# Altium schematic sheet 2_MCU.schdoc
size 297 x 209 mm; Symbol: Drawing-Symbol_A4; Device: Drawing-Symbol_A4; @Project Name: Irrigation Controller v2; @Page Count: 5; @Update Date: 2026-11-21; @Create Date: 2026-11-21; @Schematic Name: Schematic1; @Page No: 2; @Page Name: 2_MCU; Company: EasyEDA.com; Version: V1.0; Page Size: A4; @Create Time: 17:28:43; @Update Time: 17:28:43; Border: 1; Width: 1170; Height: 825; Region Start: 1; X Region Count: 6; Y Region Count: 4; Blade Width: 10; Title Block Position: 3; @Board Name: Board1
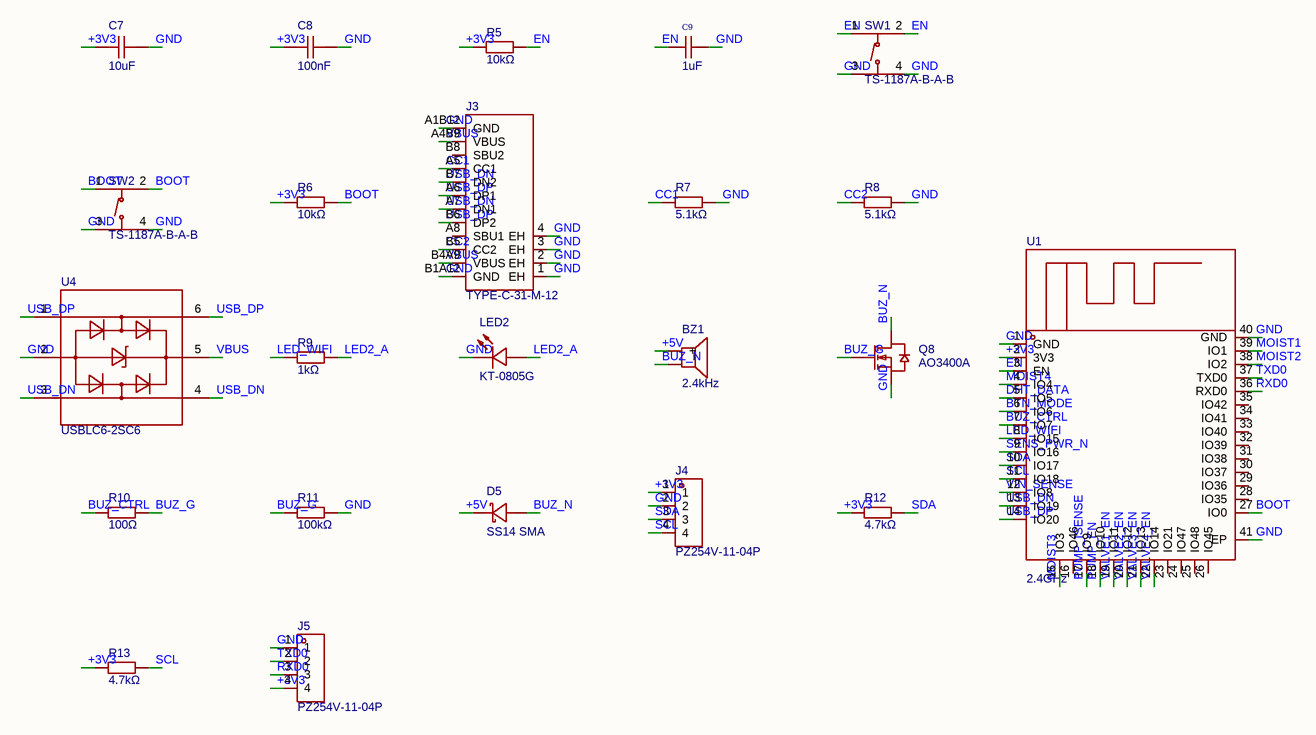
[diagram p0: 2_MCU.schdoc]

## Parts
BZ1  2.4kHz  [BUZ-TH_BD12.0-P7.60-D0.6-FD]
C7  10uF  [C0805]
C8  100nF  [C0805]
C9  1uF  [C0805]
D5  SS14 SMA  [SMA_L4.3-W2.6-LS5.1-RD]
J3  TYPE-C-31-M-12  [USB-C_SMD-TYPE-C-31-M-12_1]
J4  PZ254V-11-04P  [HDR-TH_4P-P2.54-V-M]
J5  PZ254V-11-04P  [HDR-TH_4P-P2.54-V-M]
LED2  KT-0805G  [LED0805-R-RD]
Q8  AO3400A  [SOT-23-3_L2.9-W1.3-P1.90-LS2.4-BR]
R5  10kΩ  [R0805]
R6  10kΩ  [R0805]
R7  5.1kΩ  [R0805]
R8  5.1kΩ  [R0805]
R9  1kΩ  [R0805]
R10  100Ω  [R0805]
R11  100kΩ  [R0805]
R12  4.7kΩ  [R0805]
R13  4.7kΩ  [R0805]
SW1  TS-1187A-B-A-B  [SW-SMD_4P-L5.1-W5.1-P3.70-LS6.5-TL_H1.5]
SW2  TS-1187A-B-A-B  [SW-SMD_4P-L5.1-W5.1-P3.70-LS6.5-TL_H1.5]
U1  2.4GHz  [WIFIM-SMD_ESP32-S3-WROOM-1-N8]
U4  USBLC6-2SC6  [SOT-23-6_L2.9-W1.6-P0.95-LS2.8-BL]

## Nets
+3V3: C7.1 C8.1 J4.1 J5.4 R5.1 R6.1 R12.1 R13.1 U1.2(3V3)
+5V: BZ1.1(+) D5.1(K)
BOOT: R6.2 SW2.1(A) SW2.2(B) U1.27(IO0)
BTN_MODE: U1.6(IO6)
BUZ_CTRL: R10.1 U1.7(IO7)
BUZ_G: Q8.1(G) R10.2 R11.1
BUZ_N: BZ1.2 D5.2(A) Q8.3(D)
CC1: J3.A5(CC1) R7.1
CC2: J3.B5(CC2) R8.1
DHT_DATA: U1.5(IO5)
EN: C9.1 R5.2 SW1.1(A) SW1.2(B) U1.3(EN)
GND: C7.2 C8.2 C9.2 J3.1(EH) J3.2(EH) J3.3(EH) J3.4(EH) J3.A1B12(GND) J3.B1A12(GND) J4.2 J5.1 LED2.2(K) Q8.2(S) R7.2 R8.2 R11.2 SW1.3(C) SW1.4(D) SW2.3(C) SW2.4(D) U1.1(GND) U1.40(GND) U1.41(EP) U4.2
LED2_A: LED2.1(A) R9.2
LED_WIFI: R9.1 U1.8(IO15)
MOIST1: U1.39(IO1)
MOIST2: U1.38(IO2)
MOIST3: U1.15(IO3)
MOIST4: U1.4(IO4)
PUMP_EN: U1.18(IO10)
PUMP_ISENSE: U1.17(IO9)
RXD0: J5.3 U1.36(RXD0)
SCL: J4.4 R13.2 U1.11(IO18)
SDA: J4.3 R12.2 U1.10(IO17)
SENS_PWR_N: U1.9(IO16)
TXD0: J5.2 U1.37(TXD0)
USB_DN: J3.A7(DN1) J3.B7(DN2) U1.13(IO19) U4.3 U4.4
USB_DP: J3.A6(DP1) J3.B6(DP2) U1.14(IO20) U4.1 U4.6
VALVE1_EN: U1.19(IO11)
VALVE2_EN: U1.20(IO12)
VALVE3_EN: U1.21(IO13)
VALVE4_EN: U1.22(IO14)
VBUS: J3.A4B9(VBUS) J3.B4A9(VBUS) U4.5
VIN_SENSE: U1.12(IO8)

Not connected (* = marked no-connect by the designer): J3 A8(SBU1) B8(SBU2); U1 16(IO46) 23(IO21) 24(IO47) 25(IO48) 26(IO45) 28(IO35) 29(IO36) 30(IO37) 31(IO38) 32(IO39) 33(IO40) 34(IO41) 35(IO42)

## Notes on the sheet
- Create at
- 2026-11-21
- Schematic
- Board
- Schematic1
- Board1
- Update at
- Page
- 2_MCU
- Drawn
- Reviewed
- Irrigation Controller v2
- Version
- V1.0
- Size
- A4
- Page  2  Total  5
- EasyEDA.com

## Library data of the parts
BZ1 = TMB12A05: Driver Circuitry:Active Buzzer (Built-in Driving Circuit) Technology:Electromagnetic Voltage Rating:5V Voltage - Supply:4V~8V Voltage - Supply:4V~8V Frequency:2.4kHz Current Consumption:30mA Sound Pressure Level(SPL):85dB Diameter(φD):12mm Length:- Width:; Manufacturer: 华能; Add into BOM: yes; PCB Layer: Default; Voltage Rating: 5V; Voltage - Supply: 4V~8V; Current Consumption: 30mA; Sound Pressure Level(SPL): 85dB; ModelId: 309f522c52df4298a8617da4d1b9f47c|0819f05c4eef4c71ace90d822a990e87; ModelName: BUZ-TH_D12.0-H9.5-P7.60; ModelTransform: 472.44,472.176,0,90,0,0,-0.787,0,-177.165; Symbol: TMB12A05; Device: TMB12A05; Convert to PCB: yes; Manufacturer Part: TMB12A05; Supplier: LCSC; Supplier Part: C96093; LCSC Part Name: 有源(内含驱动线路) 电磁式 2.4kHz; Supplier Footprint: 插件,D=12mm; JLCPCB Part Class: Extended Part; Datasheet: https://item.szlcsc.com/datasheet/TMB12A05/97297.html; Driver Circuitry: Active Buzzer (Built-in Driving Circuit); Technology: Electromagnetic; Value: 2.4kHz; Diameter(φD): 12mm; Length: -; Width: -; Height: 9.8mm; Operating Temperature: -40℃~+85℃; Mounting Type: Through-hole; Lead Pitch: -; Continuous Operating Time: -; FootprintName: BUZ-TH_BD12.0-P7.60-D0.6-FD
C7 = CL21A106KAYNNNE_C15850: Capacitance:10uF Tolerance:±10% Tolerance:±10% Voltage Rating:25V Temperature Coefficient:X5R; Manufacturer: SAMSUNG(三星); Add into BOM: yes; PCB Layer: Default; Tolerance: ±10%; Voltage Rating: 25V; Temperature Coefficient: X5R; ModelId: 8c88e81f49c6409b980720ec8953afb6|0819f05c4eef4c71ace90d822a990e87; ModelName: C0805_L2.0-W1.3-H1.3; ModelTransform: 78.74,51.181,0,0,0,0,0,0.0005,0; Symbol: CL21A106KAYNNNE; Device: CL21A106KAYNNNE_C15850; Convert to PCB: yes; Manufacturer Part: CL21A106KAYNNNE; Supplier: LCSC; Supplier Part: C15850; LCSC Part Name: 10uF ±10% 25V; Supplier Footprint: 0805; JLCPCB Part Class: Basic Part; Datasheet: https://item.szlcsc.com/datasheet/CL21A106KAYNNNE/16532.html; Value: 10uF; FootprintName: C0805
C8 = CC0805KRX7R9BB104: Capacitance:100nF Tolerance:±10% Tolerance:±10% Voltage Rating:50V Temperature Coefficient:X7R; Manufacturer: YAGEO(国巨); Add into BOM: yes; PCB Layer: Default; Tolerance: ±10%; Voltage Rating: 50V; Temperature Coefficient: X7R; ModelId: 8c88e81f49c6409b980720ec8953afb6|0819f05c4eef4c71ace90d822a990e87; ModelName: C0805_L2.0-W1.3-H1.3; ModelTransform: 78.74,51.181,0,0,0,0,0,0.0005,0; Symbol: CC0805KRX7R9BB104; Device: CC0805KRX7R9BB104; Convert to PCB: yes; Manufacturer Part: CC0805KRX7R9BB104; Supplier: LCSC; Supplier Part: C49678; LCSC Part Name: 100nF ±10% 50V; Supplier Footprint: 0805; JLCPCB Part Class: Basic Part; Datasheet: https://item.szlcsc.com/datasheet/CC0805KRX7R9BB104/50686.html; Value: 100nF; FootprintName: C0805
C9 = CL21B105KBFNNNE: Capacitance:1uF Tolerance:±10% Tolerance:±10% Voltage Rating:50V Temperature Coefficient:X7R; Manufacturer: SAMSUNG(三星); Add into BOM: yes; PCB Layer: Default; Tolerance: ±10%; Voltage Rating: 50V; Temperature Coefficient: X7R; ModelId: 8c88e81f49c6409b980720ec8953afb6|0819f05c4eef4c71ace90d822a990e87; ModelName: C0805_L2.0-W1.3-H1.3; ModelTransform: 78.74,51.181,0,0,0,0,0,0.0005,0; Symbol: CL21B105KBFNNNE; Device: CL21B105KBFNNNE; Convert to PCB: yes; Manufacturer Part: CL21B105KBFNNNE; Supplier: LCSC; Supplier Part: C28323; Value: 1uF; JLCPCB Part Class: Basic Part; LCSC Part Name: 1uF ±10% 50V; Supplier Footprint: 0805; Datasheet: https://item.szlcsc.com/datasheet/CL21B105KBFNNNE/29074.html; FootprintName: C0805
D5 = SS14 SMA: Diode Configuration:1 Independent Voltage - Forward(Vf@If):550mV@1A Voltage - DC Reverse(Vr):40V Current - Rectified:1A Reverse Leakage Current (Ir):500uA@40V Operating Junction Temperature Range:-65℃~+125℃ Operating Junction Temperature Range:-65℃~+125℃; Manufacturer: Yint(音特电子); Add into BOM: yes; PCB Layer: Default; Voltage - DC Reverse(Vr): 40V; Current - Rectified: 1A; Non-Repetitive Peak Forward Surge Current: 40A; ModelId: 9f0f28a3f5e244ceb50a0213b7a9858d|0819f05c4eef4c71ace90d822a990e87; ModelTransform: 196.4563,102.362,0,0,0,0,0.001,-0.001,0; Symbol: SS14 SMA; Device: SS14 SMA; Convert to PCB: yes; Manufacturer Part: SS14 SMA; Supplier: LCSC; Supplier Part: C2920036; LCSC Part Name: 电压:40V 电流:1A; Supplier Footprint: SMA(DO-214AC); JLCPCB Part Class: Extended Part; Datasheet: https://item.szlcsc.com/datasheet/SS14%2520SMA/3223905.html; Diode Configuration: 1 Independent; Voltage - Forward(Vf@If): 550mV@1A; Reverse Leakage Current (Ir): 500uA@40V; Operating Junction Temperature Range: -65℃~+125℃; FootprintName: SMA_L4.3-W2.6-LS5.1-RD; ModelName: SMA_L4.3-W2.6-LS5.1-RD
J3 = TYPE-C-31-M-12: Connector Type:Type-C Protocol Standard:- Gender:Female Mounting Type:Surface Mount, Right Angle Number of Contacts:16P Number of Ports:1 Current Rating-Power:5A Voltage Rating:20V Connect-Disconnect Life:10,000 cycles Length:7.35mm Operating Temperature:; Manufacturer: 韩国韩荣; Add into BOM: yes; PCB Layer: Default; Connector Type: Type-C; Gender: Female; Number of Contacts: 16P; Number of Ports: 1; Current Rating-Power: 5A; Voltage Rating: 20V; ModelId: 8421221a464047838322348b3a9debc3|0819f05c4eef4c71ace90d822a990e87; ModelTransform: 351.9678,311.023,0,180,0,0,0,-43.307,-33.465; Symbol: TYPE-C-31-M-12; Device: TYPE-C-31-M-12; Convert to PCB: yes; Manufacturer Part: TYPE-C-31-M-12; Supplier: LCSC; Supplier Part: C165948; LCSC Part Name: Type-C 母 卧贴; Supplier Footprint: SMD; JLCPCB Part Class: Extended Part; Datasheet: https://item.szlcsc.com/datasheet/TYPE-C-31-M-12/177331.html; Protocol Standard: -; Mounting Type: Surface Mount, Right Angle; Connect-Disconnect Life: 10,000 cycles; Length: 7.35mm; Operating Temperature: -30℃~+80℃; FootprintName: USB-C_SMD-TYPE-C-31-M-12_1; ModelName: USB-C_SMD-TYPE-C-31-M-12_1
J4 J5 = PZ254V-11-04P_C492403: Pin Structure:1x4P Pitch:2.54mm Row Spacing:- Circluar Pins/Square Pins:Square pin Mounting Type:Through Hole Number of Rows:1 Number of Pins:4P Current Rating:3A Voltage Rating (Max):250V Length of Mating Pin:6.1mm Insulation Height:2.5mm Length of End C; Manufacturer: XFCN(兴飞); Add into BOM: yes; PCB Layer: Default; Pin Structure: 1x4P; Pitch: 2.54mm; Current Rating: 3A; Voltage Rating (Max): 250V; ModelId: 69e0934d9b9245f6ab499bc5a319b3aa|0819f05c4eef4c71ace90d822a990e87; ModelName: HDR-TH_4P-P2.54-M-LI-1X4P; ModelTransform: 399.999,104.7242,0,0,0,0,0,0,-118.11; Symbol: PZ254V-11-04P; Device: PZ254V-11-04P_C492403; Convert to PCB: yes; Manufacturer Part: PZ254V-11-04P; Supplier: LCSC; Supplier Part: C492403; LCSC Part Name: 1x4P 间距:2.54mm 方针 直插; Supplier Footprint: 插件,P=2.54mm; JLCPCB Part Class: Extended Part; Datasheet: https://item.szlcsc.com/datasheet/PZ254V-11-04P/502959.html; Row Spacing: -; Circluar Pins/Square Pins: Square pin; Mounting Type: Through Hole; Number of Rows: 1; Number of Pins: 4P; Length of Mating Pin: 6.1mm; Insulation Height: 2.5mm; Length of End Connection Pin: 3mm; Contact Material: Brass; Contact Plating: Gold; Operating Temperature: -40℃~+105℃; Color: Black; FootprintName: HDR-TH_4P-P2.54-V-M
LED2 = KT-0805G: Lamp Holder Type:2mm x 1.25mm square LED Illumination Color:Emerald Green Voltage - Forward(Vf):2.6V~3.1V Voltage - Forward(Vf):2.6V~3.1V Power(Watts):100mW Forward Current:5mA Wavelength - Dominant:513nm~528nm Wavelength - Dominant:513nm~528nm Peak Wavel; Manufacturer: KENTO; Symbol: 0805G (Green); Add into BOM: yes; PCB Layer: Default; Power(Watts): 100mW; Forward Current: 5mA; Peak Wavelength: 525nm; Diode Configuration: Discrete Diode; Lens Color: Water Clear; Luminous Intensity: 430mcd; Viewing Angle: 120°; ModelId: 167045bb0eae412b9d5564860e113a91|0819f05c4eef4c71ace90d822a990e87; ModelName: LED0805-RD; ModelTransform: 79.527,49.2125,0,0,0,0,0,0,0; Device: KT-0805G; Convert to PCB: yes; Manufacturer Part: KT-0805G; Supplier: LCSC; Supplier Part: C2297; LCSC Part Name: 0805 翠绿 高亮; Supplier Footprint: 0805; JLCPCB Part Class: Basic Part; Datasheet: https://item.szlcsc.com/datasheet/KT-0805G/2670.html; Lamp Holder Type: 2mm x 1.25mm square LED; Illumination Color: Emerald Green; Voltage - Forward(Vf): 2.6V~3.1V; Wavelength - Dominant: 513nm~528nm; Color Temperature: -; Mounting Style: -; Operating Temperature: -40℃~+85℃; FootprintName: LED0805-R-RD
Q8 = AO3400A_C20917: Number:1 N-channel Drain to Source Voltage:30V Current - Continuous Drain(Id):5.7A RDS(on):48mΩ@2.5V Pd - Power Dissipation:1.4W Gate Threshold Voltage (Vgs(th)):1.45V Gate Charge(Qg):7nC@10V Input Capacitance(Ciss):630pF Reverse Transfer Capacitance (Crs; Manufacturer: AOS; Add into BOM: yes; PCB Layer: Default; Drain to Source Voltage: 30V; Current - Continuous Drain(Id): 5.7A; Pd - Power Dissipation: 1.4W; Gate Threshold Voltage (Vgs(th)): 1.45V; Input Capacitance(Ciss): 630pF; Reverse Transfer Capacitance (Crss@Vds): 50pF; Output Capacitance(Coss): 75pF; Vgs: ±12V; ModelId: 62a57c6760504a01965db6419a6d07df|0819f05c4eef4c71ace90d822a990e87; ModelName: SOT-23-3P_L2.9-W1.3-H1.0-LS2.4-P0.95; ModelTransform: 98.425,114.173,0,180,0,0,0.0005,-0.0005,0; Symbol: AO3400A; Device: AO3400A_C20917; Convert to PCB: yes; Manufacturer Part: AO3400A; Supplier: LCSC; Supplier Part: C20917; LCSC Part Name: N沟道 耐压:30V; Supplier Footprint: SOT-23; JLCPCB Part Class: Basic Part; Datasheet: https://item.szlcsc.com/datasheet/AO3400A/21629.html; Number: 1 N-channel; RDS(on): 48mΩ@2.5V; Gate Charge(Qg): 7nC@10V; Operating Temperature: -55℃~+150℃; Configuration: -; Type: N-Channel; FootprintName: SOT-23-3_L2.9-W1.3-P1.90-LS2.4-BR
R5 R6 = 0805W8F1002T5E: Type:Thick Film Resistor Resistance:10kΩ Tolerance:±1% Tolerance:±1% Power(Watts):125mW Voltage-Supply(Max):150V Temperature Coefficient:±100ppm/℃ Temperature Coefficient:±100ppm/℃ Operating Temperature:-55℃~+155℃ Operating Temperature:-55℃~+155℃; Manufacturer: UNI-ROYAL(厚声); Add into BOM: yes; PCB Layer: Default; Tolerance: ±1%; Power(Watts): 125mW; Voltage-Supply(Max): 150V; ModelId: b83c7c5430874b8eb2319a65d9433429|0819f05c4eef4c71ace90d822a990e87; ModelName: R0805_L2.0-W1.3-H0.6; ModelTransform: 78.74,51.181,0,0,0,0,0,-0.0005,0; Symbol: 0805W8F1002T5E; Device: 0805W8F1002T5E; Convert to PCB: yes; Manufacturer Part: 0805W8F1002T5E; Supplier: LCSC; Supplier Part: C17414; LCSC Part Name: 厚膜电阻 10kΩ ±1%; Supplier Footprint: 0805; JLCPCB Part Class: Basic Part; Datasheet: https://item.szlcsc.com/datasheet/0805W8F1002T5E/18102.html; Type: Thick Film Resistor; Value: 10kΩ; Temperature Coefficient: ±100ppm/℃; Operating Temperature: -55℃~+155℃; FootprintName: R0805
R7 R8 = 0805W8F5101T5E: Type:Thick Film Resistor Resistance:5.1kΩ Tolerance:±1% Tolerance:±1% Power(Watts):125mW Voltage-Supply(Max):150V Temperature Coefficient:±100ppm/℃ Temperature Coefficient:±100ppm/℃ Operating Temperature:-55℃~+155℃ Operating Temperature:-55℃~+155℃; Manufacturer: UNI-ROYAL(厚声); Add into BOM: yes; PCB Layer: Default; Tolerance: ±1%; Power(Watts): 125mW; Voltage-Supply(Max): 150V; ModelId: b83c7c5430874b8eb2319a65d9433429|0819f05c4eef4c71ace90d822a990e87; ModelName: R0805_L2.0-W1.3-H0.6; ModelTransform: 78.74,51.181,0,0,0,0,0,-0.0005,0; Symbol: 0805W8F5101T5E; Device: 0805W8F5101T5E; Convert to PCB: yes; Manufacturer Part: 0805W8F5101T5E; Supplier: LCSC; Supplier Part: C27834; LCSC Part Name: 厚膜电阻 5.1kΩ ±1%; Supplier Footprint: 0805; JLCPCB Part Class: Basic Part; Datasheet: https://item.szlcsc.com/datasheet/0805W8F5101T5E/28584.html; Type: Thick Film Resistor; Value: 5.1kΩ; Temperature Coefficient: ±100ppm/℃; Operating Temperature: -55℃~+155℃; FootprintName: R0805
R9 = 0805W8F1001T5E: Type:Thick Film Resistors Resistance:1kΩ Tolerance:±1% Tolerance:±1% Power(Watts): Overload Voltage (Max): Temperature Coefficient:±100ppm/℃ Temperature Coefficient:±100ppm/℃ Operating Temperature Range:-55℃~+155℃ Operating Temperature Range:-55℃~+155℃; Manufacturer: UNI-ROYAL(厚声); Add into BOM: yes; PCB Layer: Default; Tolerance: ±1%; ModelId: b83c7c5430874b8eb2319a65d9433429|0819f05c4eef4c71ace90d822a990e87; ModelName: R0805_L2.0-W1.3-H0.6; ModelTransform: 78.74,51.181,0,0,0,0,0,-0.0005,0; Symbol: 0805W8F1001T5E; Device: 0805W8F1001T5E; Convert to PCB: yes; Manufacturer Part: 0805W8F1001T5E; Supplier: LCSC; Supplier Part: C17513; LCSC Part Name: 1kΩ ±1% 125mW 厚膜电阻; Supplier Footprint: 0805; JLCPCB Part Class: Basic Part; Datasheet: https://atta.szlcsc.com/upload/public/pdf/source/20200306/C422600_1E6D84923E4A46A82E41ADD87F860B5C.pdf; Type: Thick Film Resistors; Value: 1kΩ; Temperature Coefficient: ±100ppm/℃; Operating Temperature Range: -55℃~+155℃; FootprintName: R0805
R10 = 0805W8F1000T5E_C17408: Type:Thick Film Resistors Resistance: Tolerance:±1% Tolerance:±1% Power(Watts): Overload Voltage (Max): Temperature Coefficient:±100ppm/℃ Temperature Coefficient:±100ppm/℃ Operating Temperature Range:-55℃~+155℃ Operating Temperature Range:-55℃~+155℃; Manufacturer: UNI-ROYAL(厚声); Add into BOM: yes; PCB Layer: Default; Tolerance: ±1%; ModelId: b83c7c5430874b8eb2319a65d9433429|0819f05c4eef4c71ace90d822a990e87; ModelName: R0805_L2.0-W1.3-H0.6; ModelTransform: 78.74,51.181,0,0,0,0,0,-0.0005,0; Symbol: 0805W8F1000T5E; Device: 0805W8F1000T5E_C17408; Convert to PCB: yes; Manufacturer Part: 0805W8F1000T5E; Supplier: LCSC; Supplier Part: C17408; LCSC Part Name: 100Ω ±1% 125mW 厚膜电阻; Supplier Footprint: 0805; JLCPCB Part Class: Basic Part; Datasheet: https://atta.szlcsc.com/upload/public/pdf/source/20200306/C422600_1E6D84923E4A46A82E41ADD87F860B5C.pdf; Type: Thick Film Resistors; Value: 100Ω; Temperature Coefficient: ±100ppm/℃; Operating Temperature Range: -55℃~+155℃; FootprintName: R0805
R11 = 0805W8F1003T5E (SMT业务专用): Type: Resistance: Tolerance:±1% Tolerance:±1% Power(Watts):- Overload Voltage (Max):-; Manufacturer: UNI-ROYAL(厚声); Add into BOM: yes; PCB Layer: Default; Tolerance: ±1%; ModelId: b83c7c5430874b8eb2319a65d9433429|0819f05c4eef4c71ace90d822a990e87; ModelName: R0805_L2.0-W1.3-H0.6; ModelTransform: 78.74,51.181,0,0,0,0,0,-0.0005,0; Symbol: 0805W8F1003T5E; Device: 0805W8F1003T5E (SMT业务专用); Convert to PCB: yes; Manufacturer Part: 0805W8F1003T5E (SMT业务专用); Supplier: LCSC; Supplier Part: C17407; LCSC Part Name: 100kΩ ±1%; Supplier Footprint: 0805; JLCPCB Part Class: Extended Part; Datasheet: https://atta.szlcsc.com/upload/public/pdf/source/20200102/C423413_58AC64FF5730584578C10BF0002471B1.pdf; Value: 100kΩ; Power(Watts): -; Overload Voltage (Max): -; FootprintName: R0805
R12 R13 = 0805W8F4701T5E: Type:Thick Film Resistors Resistance:4.7kΩ Tolerance:±1% Tolerance:±1% Power(Watts): Overload Voltage (Max): Temperature Coefficient:±100ppm/℃ Temperature Coefficient:±100ppm/℃ Operating Temperature Range:-55℃~+155℃ Operating Temperature Range:-55℃~+155℃; Manufacturer: UNI-ROYAL(厚声); Add into BOM: yes; PCB Layer: Default; Tolerance: ±1%; ModelId: b83c7c5430874b8eb2319a65d9433429|0819f05c4eef4c71ace90d822a990e87; ModelName: R0805_L2.0-W1.3-H0.6; ModelTransform: 78.74,51.181,0,0,0,0,0,-0.0005,0; Symbol: 0805W8F4701T5E; Device: 0805W8F4701T5E; Convert to PCB: yes; Manufacturer Part: 0805W8F4701T5E; Supplier: LCSC; Supplier Part: C17673; LCSC Part Name: 4.7kΩ ±1% 125mW 厚膜电阻; Supplier Footprint: 0805; JLCPCB Part Class: Basic Part; Datasheet: https://atta.szlcsc.com/upload/public/pdf/source/20200306/C422600_1E6D84923E4A46A82E41ADD87F860B5C.pdf; Type: Thick Film Resistors; Value: 4.7kΩ; Temperature Coefficient: ±100ppm/℃; Operating Temperature Range: -55℃~+155℃; FootprintName: R0805
SW1 SW2 = TS-1187A-B-A-B: Circuit:SPST Actuator Style:Round Button Operating Force:1.6N Mounting Type:Surface Mount,Vertical Length:5.1mm Width:5.1mm Switch Height:1.5mm with Bracket:Without Bracket Contact Current:50mA Voltage Rating:12V Actuator/Cap Color:Gold With Lamp:No Life:; Manufacturer: XKB Connection(中国星坤); Add into BOM: yes; PCB Layer: Default; Circuit: SPST; Operating Force: 1.6N; Switch Height: 1.5mm; Contact Current: 50mA; Voltage Rating: 12V; Actuator/Cap Color: Gold; With Lamp: No; Life: 100,000 cycles; ModelId: 297e93217c8a461096f3cf9cc3d4db3d|0819f05c4eef4c71ace90d822a990e87; ModelTransform: 255.905,204.76337,0,0,0,0,0,0,0; Symbol: TS-1187A-B-A-B; Device: TS-1187A-B-A-B; Convert to PCB: yes; Manufacturer Part: TS-1187A-B-A-B; Supplier: LCSC; Supplier Part: C318884; LCSC Part Name: 5.1*5.1*1.5mm 立贴 轻触开关; Supplier Footprint: SMD-4P,5.1x5.1mm; JLCPCB Part Class: Basic Part; Datasheet: https://item.szlcsc.com/datasheet/TS-1187A-B-A-B/299976.html; Actuator Style: Round Button; Mounting Type: Surface Mount,Vertical; Length: 5.1mm; Width: 5.1mm; with Bracket: Without Bracket; Operating Temperature: -30℃~+85℃; FootprintName: SW-SMD_4P-L5.1-W5.1-P3.70-LS6.5-TL_H1.5; ModelName: SW-SMD_4P-L5.1-W5.1-P3.70-LS6.5-TL_H1.5
U1 = ESP32-S3-WROOM-1-N8: Utilized IC / Part:ESP32-S3 Chip Wireless Standard:Bluetooth5.0 Interface Type:SPI；I2S；USB；I2C；UART Frequency:2.4GHz Antenna Type:On-board PCB Antenna Output Power:20.5dBm Output Power:20.5dBm Voltage - Supply:3V~3.6V Voltage - Supply:3V~3.6V Receive  Cur; Manufacturer: ESPRESSIF(乐鑫); Add into BOM: yes; PCB Layer: Default; Receive  Current: 95mA; Send  Current: 355mA; Sensitivity: -98.2dBm; ModelId: 2ad47579e90e49a3ad8b3736302063ed|0819f05c4eef4c71ace90d822a990e87; ModelTransform: 708.66,1003.935,0,0,0,0,0,145.669,0; Symbol: ESP32-S3-WROOM-1-N8; Device: ESP32-S3-WROOM-1-N8; Convert to PCB: yes; Manufacturer Part: ESP32-S3-WROOM-1-N8; Supplier: LCSC; Supplier Part: C2913198; LCSC Part Name: 不带固件 不带固件 通用型Wi-Fi+低功耗蓝牙MCU模组; Supplier Footprint: SMD,25.5x18mm; JLCPCB Part Class: Extended Part; Datasheet: https://item.szlcsc.com/datasheet/ESP32-S3-WROOM-1-N8/3198296.html; Utilized IC / Part: ESP32-S3 Chip; Wireless Standard: Bluetooth5.0; Interface Type: SPI；I2S；USB；I2C；UART; Value: 2.4GHz; Antenna Type: On-board PCB Antenna; Output Power: 20.5dBm; Voltage - Supply: 3V~3.6V; Operating Temperature: -40℃~+85℃; FootprintName: WIFIM-SMD_ESP32-S3-WROOM-1-N8; ModelName: WIFIM-SMD_ESP32-S3-WROOM-1-N8
U4 = USBLC6-2SC6_C7519: Polarity:Unidirectional Reverse Stand-Off Voltage (Vrwm):5.25V Clamping Voltage:17V Peak Pulse Current (Ipp):5A Voltage - Breakdown:6V Reverse Leakage Current (Ir):150nA Number of Channels:2 Operating Temperature:-40℃~+125℃ Operating Temperature:-40℃~+125; Manufacturer: ST(意法半导体); Add into BOM: yes; PCB Layer: Default; Reverse Stand-Off Voltage (Vrwm): 5.25V; Clamping Voltage: 17V; Peak Pulse Current (Ipp): 5A; Voltage - Breakdown: 6V; Reverse Leakage Current (Ir): 150nA; Number of Channels: 2; level of protection: IEC 61000-4-2; Junction Capacitance: 3.5pF; ModelId: 1370be37a17e44418ae52e2b4cc1f5e5|0819f05c4eef4c71ace90d822a990e87; ModelName: SOT-23-6_L2.9-W1.6-H1.5-LS2.8-P0.95; ModelTransform: 110.236,113.364,0,90,0,0,0.0005,0.0005,0; Symbol: USBLC6-2SC6; Device: USBLC6-2SC6_C7519; Convert to PCB: yes; Manufacturer Part: USBLC6-2SC6; Supplier: LCSC; Supplier Part: C7519; LCSC Part Name: 单向ESD 5.25V截止 峰值脉冲电流：5A; Supplier Footprint: SOT-23-6L; JLCPCB Part Class: Extended Part; Datasheet: https://item.szlcsc.com/datasheet/USBLC6-2SC6/7996.html; Polarity: Unidirectional; Operating Temperature: -40℃~+125℃; Type: ESD; FootprintName: SOT-23-6_L2.9-W1.6-P0.95-LS2.8-BL